# Altium schematic sheet schematic.schdoc
size 431 x 309 mm; Symbol: Sheet-Symbol_A3; Device: Sheet-Symbol_A3; Company: 深圳嘉立创科技发展有限公司; Drawed: 嘉立创EDA; Reviewed: 嘉立创EDA; Version: V0.1; Page Size: A3; @Project Name: 毕设成品 - 一期项目; @Page Count: 3; @Update Date: 2024-11-05; @Create Date: 2024-11-05; @Schematic Name: Schematic1; Part Number: JLCPCB-001; @Page No: 2; @Page Name: 普通版; Convert to PCB: yes; Add into BOM: yes; @Board Name: 1基于STM32单片机智能手环; @Create Time: 14:46:41; @Update Time: 14:47:32; Width: 1656; Height: 1171; Region Start: 1; X Region Count: 1; Y Region Count: 1; Title Block Position: 3
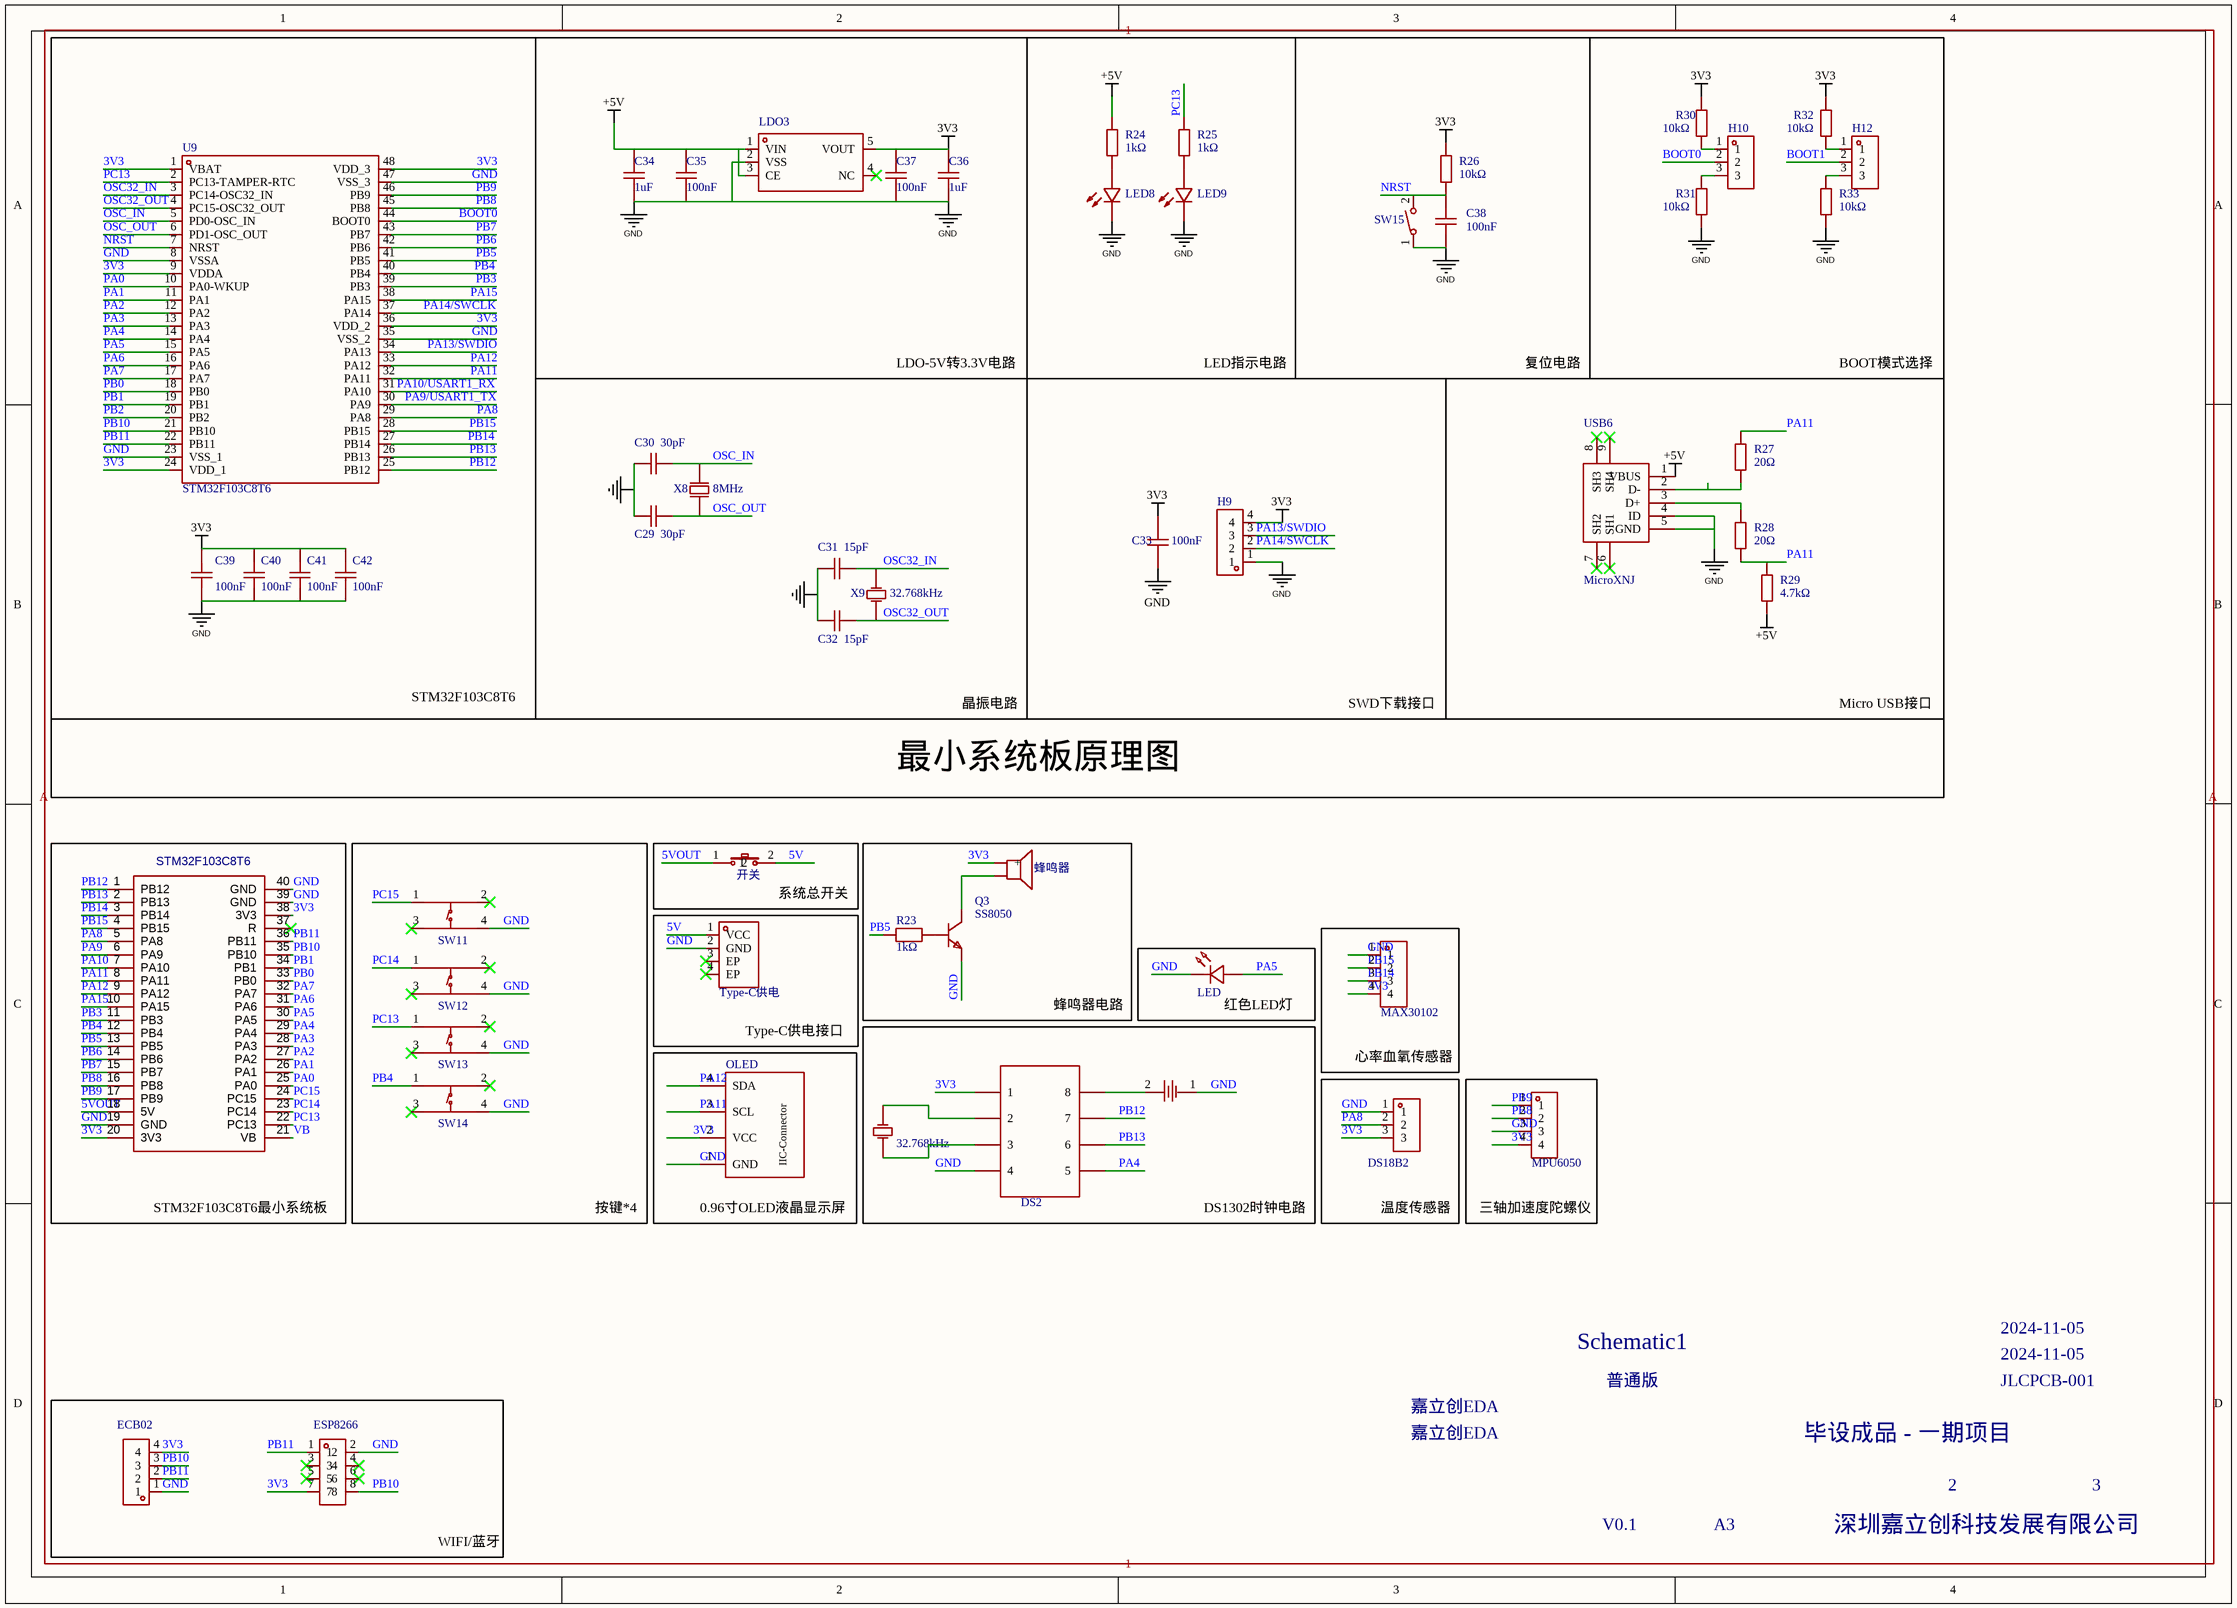
[diagram p0: schematic.schdoc]

## Parts
B3  BS-02-A1AJ010  [BAT-TH_BS-02-A1AJ010]  (value not drawn)
BUZZER  蜂鸣器  [BUZ-TH_BD12.0-P7.60-D0.6-FD]  (value not drawn)
C29  30pF  [C0603]  (value not drawn)
C30  30pF  [C0603]  (value not drawn)
C31  15pF  [C0603]  (value not drawn)
C32  15pF  [C0603]  (value not drawn)
C33  100nF  [C0603]  (value not drawn)
C34  1uF  [C0603]  (value not drawn)
C35  100nF  [C0603]  (value not drawn)
C36  1uF  [C0603]  (value not drawn)
C37  100nF  [C0603]  (value not drawn)
C38  100nF  [C0603]  (value not drawn)
C39  100nF  [C0603]  (value not drawn)
C40  100nF  [C0603]  (value not drawn)
C41  100nF  [C0603]  (value not drawn)
C42  100nF  [C0603]  (value not drawn)
DS2  DS1009-08AT1NX-0A2  [DIP-8_L10.2-W10.2-P2.54-LS7.6-BL]  (value not drawn)
DS18B2  PZ254V-11-03P  [HDR-TH_3P-P2.54-V-M]  (value not drawn)
ECB2  ECB02  [HDR-TH_4P-P2.54-V-F]  (value not drawn)
H9  DZ254W-11-04-65  [HDR-TH_4P-P2.54-H-M-W10.3]  (value not drawn)
H10  PZ254V-11-03P  [HDR-TH_3P-P2.54-V-M]  (value not drawn)
H11  ESP8266  [HDR-TH_8P-P2.54-V-F-R2-C4-S2.54]  (value not drawn)
H12  PZ254V-11-03P  [HDR-TH_3P-P2.54-V-M]  (value not drawn)
LDO3  ME6211C33M5G-N  [SOT-23-5_L3.0-W1.7-P0.95-LS2.8-BL]  (value not drawn)
LED7  LED  [LED-TH_BD3.8-P2.54-FD_GREEN]  (value not drawn)
LED8  NCD0603R1  [LED0603-RD_RED]  (value not drawn)
LED9  NCD0603G1  [LED0603-RD]  (value not drawn)
MAX2  MAX30102  [HDR-TH_4P-P2.54-V-F]  (value not drawn)
MPU2  MPU6050  [HDR-TH_4P-P2.54-V-F]  (value not drawn)
OLED  OLED  [0.96OLED_4P]  (value not drawn)
Q3  SS8050  [TO-92-3_L4.6-W3.6-P1.27-L]  (value not drawn)
R23  1kΩ  [RES-TH_BD2.7-L6.2-P10.20-D0.4]  (value not drawn)
R24  1kΩ  [R0603]  (value not drawn)
R25  1kΩ  [R0603]  (value not drawn)
R26  10kΩ  [R0603]  (value not drawn)
R27  20Ω  [R0603]  (value not drawn)
R28  20Ω  [R0603]  (value not drawn)
R29  4.7kΩ  [R0603]  (value not drawn)
R30  10kΩ  [R0603]  (value not drawn)
R31  10kΩ  [R0603]  (value not drawn)
R32  10kΩ  [R0603]  (value not drawn)
R33  10kΩ  [R0603]  (value not drawn)
SW11  KEY1  [SW-TH_4P-L6.0-W6.0-P4.50-LS6.5]  (value not drawn)
SW12  KEY1  [SW-TH_4P-L6.0-W6.0-P4.50-LS6.5]  (value not drawn)
SW13  KEY1  [SW-TH_4P-L6.0-W6.0-P4.50-LS6.5]  (value not drawn)
SW14  KEY1  [SW-TH_4P-L6.0-W6.0-P4.50-LS6.5]  (value not drawn)
SW15  TS-1101-B-W  [KEY-SMD_2P-L6.0-W3.6-P7.4-LS8.0-L]  (value not drawn)
SWITCH  开关  [KCD11-101]  (value not drawn)
U7  STM32F103C8T6  [STM32F103C8T6]  (value not drawn)
U9  STM32F103C8T6  [LQFP-48_L7.0-W7.0-P0.50-LS9.0-BL]  (value not drawn)
USB5  Type-C供电  [USB-SMD_KH-TYPE-C-2P]  (value not drawn)
USB6  MicroXNJ  [MICRO-USB-SMD_MICROXNJ]  (value not drawn)
X7  32.768kHz  [OSC-TH_BD3.1-P0.8-D0.3]  (value not drawn)
X8  8MHz  [HC-49US_L11.5-W4.5-P4.88]  (value not drawn)
X9  32.768kHz  [OSC-TH_BD2.0-P0.70-D0.3]  (value not drawn)

## Blocks framed on the sheet
最小系统板原理图: C29-C42 H9 H10 H12 LDO3 LED8 LED9 R24-R33 SW15 U9 USB6 X8 X9
STM32F103C8T6最小系统板: U7
按键*4: SW11-SW14
系统总开关: SWITCH
蜂鸣器电路: BUZZER Q3 R23
Type-C供电接口: USB5
心率血氧传感器: MAX2
红色LED灯: LED7
DS1302时钟电路: B3 DS2 X7
0.96寸OLED液晶显示屏: OLED
三轴加速度陀螺仪: MPU2
WIFI/蓝牙: ECB2 H11

## Nets
3V3: BUZZER.1(+) C33.1 C36.2 C37.2 C39.1 C40.1 C41.1 C42.1 DS2.1 DS18B2.3 ECB2.4 H9.4 H11.7 LDO3.5(VOUT) MAX2.4 MPU2.4 OLED.2(VCC) R26.2 R30.2 R32.2 U7.20(3V3) U7.38(3V3) U9.1(VBAT) U9.9(VDDA) U9.24(VDD_1) U9.36(VDD_2) U9.48(VDD_3)
+5V: C34.2 C35.2 LDO3.1(VIN) LDO3.3(CE) R24.1 R29.1 USB6.1(VBUS)
GND: B3.1 C29.2 C30.2 C31.1 C32.1 C33.2 C34.1 C35.1 C36.1 C37.1 C38.1 C39.2 C40.2 C41.2 C42.2 DS2.4 DS18B2.1 ECB2.1 H9.1 H11.2 LDO3.2(VSS) LED7.2(K) LED8.1(K) LED9.1(K) MAX2.1 MPU2.3 OLED.1(GND) Q3.1(E) R31.1 R33.1 SW11.4(D) SW12.4(D) SW13.4(D) SW14.4(D) SW15.1 U7.19(GND) U7.39(GND) U7.40(GND) U9.8(VSSA) U9.23(VSS_1) U9.35(VSS_2) U9.47(VSS_3) USB5.2(GND) USB6.4(ID) USB6.5(GND)
5V: SWITCH.2 USB5.1(VCC)
5VOUT: SWITCH.1 U7.18(5V)
BOOT0: H10.2 U9.44(BOOT0)
BOOT1: H12.2
NRST: C38.2 R26.1 SW15.2 U9.7(NRST)
OSC32_IN: C31.2 U9.3(PC14-OSC32_IN) X9.2(OSC2)
OSC32_OUT: C32.2 U9.4(PC15-OSC32_OUT) X9.1(OSC1)
OSC_IN: C30.1 U9.5(PD0-OSC_IN) X8.2(OSC2)
OSC_OUT: C29.1 U9.6(PD1-OSC_OUT) X8.1(OSC1)
PA0: U7.25(PA0) U9.10(PA0-WKUP)
PA1: U7.26(PA1) U9.11(PA1)
PA2: U7.27(PA2) U9.12(PA2)
PA3: U7.28(PA3) U9.13(PA3)
PA4: DS2.5 U7.29(PA4) U9.14(PA4)
PA5: LED7.1(A) U7.30(PA5) U9.15(PA5)
PA6: U7.31(PA6) U9.16(PA6)
PA7: U7.32(PA7) U9.17(PA7)
PA8: DS18B2.2 U7.5(PA8) U9.29(PA8)
PA9: U7.6(PA9)
PA9/USART1_TX: U9.30(PA9)
PA10: U7.7(PA10)
PA10/USART1_RX: U9.31(PA10)
PA11: OLED.3(SCL) R27.2 R28.1 R29.2 U7.8(PA11) U9.32(PA11)
PA12: OLED.4(SDA) U7.9(PA12) U9.33(PA12)
PA13/SWDIO: H9.3 U9.34(PA13)
PA14/SWCLK: H9.2 U9.37(PA14)
PA15: U7.10(PA15) U9.38(PA15)
PB0: U7.33(PB0) U9.18(PB0)
PB1: U7.34(PB1) U9.19(PB1)
PB2: U9.20(PB2)
PB3: U7.11(PB3) U9.39(PB3)
PB4: SW14.1(A) U7.12(PB4) U9.40(PB4)
PB5: R23.1 U7.13(PB5) U9.41(PB5)
PB6: U7.14(PB6) U9.42(PB6)
PB7: U7.15(PB7) U9.43(PB7)
PB8: MPU2.2 U7.16(PB8) U9.45(PB8)
PB9: MPU2.1 U7.17(PB9) U9.46(PB9)
PB10: ECB2.3 H11.8 U7.35(PB10) U9.21(PB10)
PB11: ECB2.2 H11.1 U7.36(PB11) U9.22(PB11)
PB12: DS2.7 U7.1(PB12) U9.25(PB12)
PB13: DS2.6 U7.2(PB13) U9.26(PB13)
PB14: MAX2.3 U7.3(PB14) U9.27(PB14)
PB15: MAX2.2 U7.4(PB15) U9.28(PB15)
PC13: R25.1 SW13.1(A) U7.22(PC13) U9.2(PC13-TAMPER-RTC)
PC14: SW12.1(A) U7.23(PC14)
PC15: SW11.1(A) U7.24(PC15)
VB: U7.21(VB)
NetB3_2: B3.2 DS2.8
NetBUZZER_2: BUZZER.2 Q3.3(C)
NetDS2_2: DS2.2 X7.2(OSC2)
NetDS2_3: DS2.3 X7.1(OSC1)
NetH10_1: H10.1 R30.1
NetH10_3: H10.3 R31.2
NetH12_1: H12.1 R32.1
NetH12_3: H12.3 R33.2
NetLED8_2: LED8.2(A) R24.2
NetLED9_2: LED9.2(A) R25.2
NetQ3_2: Q3.2(B) R23.2
NetR27_1: R27.1 USB6.2(D-)
NetR28_2: R28.2 USB6.3(D+)

Not connected (* = marked no-connect by the designer): H11 3* 4* 5* 6*; LDO3 4(NC)*; SW11 2(B)* 3(C)*; SW12 2(B)* 3(C)*; SW13 2(B)* 3(C)*; SW14 2(B)* 3(C)*; U7 37(R)*; USB5 3(EP)* 4(EP)*; USB6 6(SH1)* 7(SH2)* 8(SH3)* 9(SH4)*

## Notes on the sheet
- LDO-5V转3.3V电路
- LED指示电路
- 复位电路
- BOOT模式选择
- STM32F103C8T6
- 晶振电路
- SWD下载接口
- Micro USB接口
- 温度传感器
- 1
- A
- Schematic1
- 2024-11-05
- 嘉立创EDA
- 普通版
- 毕设成品 - 一期项目
- JLCPCB-001
- 2
- 3
- V0.1
- A3
- 深圳嘉立创科技发展有限公司
- (in symbol 0.96OLED_4P_MODULE_JX) IIC-Connector

## Library data of the parts
B3 = BS-02-A1AJ010: 连接器类型:电池底座;适用电池规格:CR2032;触头材质:磷青铜;触点电镀:镍;工作温度范围:-25℃~+85℃;; Manufacturer: MYOUNG(美阳); Add into BOM: yes; Connector Type: 电池底座; Battery Type: CR2032; Symbol: BS-02-A1AJ010; Device: BS-02-A1AJ010; LCSC Part Name: 电池底座 适用电池:CR2032; Supplier Part: C5239862; Manufacturer Part: BS-02-A1AJ010; Supplier Footprint: 插件; JLCPCB Part Class: 扩展库; Datasheet: https://atta.szlcsc.com/upload/public/pdf/source/20221102/8F00F2B23A2A3C447A59C327BBA6C743.pdf; Supplier: LCSC; Convert to PCB: yes; Contact Material: 磷青铜; Contact Plating: 镍; Operating Temperature Range: -25℃~+85℃
BUZZER = SUN-12075-5VPA7.6: 驱动方式:有源(内含驱动线路);构造类型:电磁式;额定电压:5V;工作电压:4V~7V;频率:2700Hz;声压(SPL):85dB@5V,10cm;直径(φD):12mm;高度:8mm;; Manufacturer: S&amp;S(海旭); Add into BOM: yes; Technology Type: 电磁式; Rated Voltage: 5V; Operating Voltage: 4V~7V; Symbol: SUN-12075-5VPA7.6; Device: SUN-12075-5VPA7.6; LCSC Part Name: 电磁有源蜂鸣器; Supplier Part: C360613; Manufacturer Part: SUN-12075-5VPA7.6; Supplier Footprint: 插件,P=7.6mm; JLCPCB Part Class: 扩展库; Datasheet: https://atta.szlcsc.com/upload/public/pdf/source/20190311/C360613_1C5D9ABE8587B492981AAE455EC055DD.pdf; Supplier: LCSC; Convert to PCB: yes; Oscillator Circuit: 有源(内含驱动线路); Value: 蜂鸣器; Sound Pressure Level (SPL): 85dB@5V,10cm; Diameter (φD): 12mm; Height: 8mm
C29 C30 = 0603CG300J500NT: 容值:30pF;精度:±5%;额定电压:50V;材质(温度系数):C0G;; Manufacturer: FH(风华); Add into BOM: yes; Tolerance: ±5%; Voltage Rated: 50V; Temperature Coefficient: C0G; Symbol: 0603CG300J500NT; Device: 0603CG300J500NT; LCSC Part Name: 30pF ±5% 50V; Supplier Part: C1658; Manufacturer Part: 0603CG300J500NT; Supplier Footprint: 0603; JLCPCB Part Class: 基础库; Datasheet: https://atta.szlcsc.com/upload/public/pdf/source/20200305/C486355_26A10D38EF8C2A5C37091D0039909270.pdf; Supplier: LCSC; Convert to PCB: yes; Value: 30pF
C31 C32 = CL10C150JB8NNNC: 容值:15pF;精度:±5%;额定电压:50V;材质(温度系数):C0G;; Manufacturer: SAMSUNG(三星); Add into BOM: yes; Tolerance: ±5%; Voltage Rated: 50V; Temperature Coefficient: C0G; Symbol: CL10C150JB8NNNC; Device: CL10C150JB8NNNC; LCSC Part Name: 15pF ±5% 50V; Supplier Part: C1644; Manufacturer Part: CL10C150JB8NNNC; Supplier Footprint: 0603; JLCPCB Part Class: 基础库; Datasheet: https://atta.szlcsc.com/upload/public/pdf/source/20160218/1457707763339.pdf; Supplier: LCSC; Convert to PCB: yes; Value: 15pF
C33 C35 C37-C42 = CC0603KRX7R9BB104: 容值:100nF;精度:±10%;额定电压:50V;材质(温度系数):X7R;; Manufacturer: YAGEO(国巨); Add into BOM: yes; Tolerance: ±10%; Voltage Rated: 50V; Temperature Coefficient: X7R; Symbol: CC0603KRX7R9BB104; Device: CC0603KRX7R9BB104; Supplier: LCSC; Manufacturer Part: CC0603KRX7R9BB104; Value: 100nF; Supplier Part: C14663; JLCPCB Part Class: 基础库; LCSC Part Name: 100nF ±10% 50V; Supplier Footprint: 0603; Datasheet: https://atta.szlcsc.com/upload/public/pdf/source/20180910/C282072_33301C7F631E79921B82A8DAC6BCC5B3.pdf; Convert to PCB: yes
C34 C36 = CL10A105KB8NNNC: 容值:1uF;精度:±10%;额定电压:50V;材质(温度系数):X5R;; Manufacturer: SAMSUNG(三星); Add into BOM: yes; Tolerance: ±10%; Voltage Rated: 50V; Temperature Coefficient: X5R; Symbol: CL10A105KB8NNNC; Device: CL10A105KB8NNNC; LCSC Part Name: 1uF ±10% 50V; Supplier Part: C15849; Manufacturer Part: CL10A105KB8NNNC; Supplier Footprint: 0603; JLCPCB Part Class: 基础库; Datasheet: https://atta.szlcsc.com/upload/public/pdf/source/20160218/1457707763339.pdf; Supplier: LCSC; Convert to PCB: yes; Value: 1uF
DS2 = DS1009-08AT1NX-0A2: 适用IC封装类型:DIP;间距:2.54mm;行距:7.62mm;总针脚数:8P;触头镀层:锡;; Manufacturer: CONNFLY; Add into BOM: yes; IC Type: DIP; Pitch: 2.54mm; Row Spacing: 7.62mm; Number of Positions: 8P; Symbol: DS1009-08AT1NX-0A2; Device: DS1009-08AT1NX-0A2; LCSC Part Name: 间距2.54mm P数:8P; Supplier Part: C72124; Manufacturer Part: DS1009-08AT1NX-0A2; Supplier Footprint: DIP-8; JLCPCB Part Class: 扩展库; Datasheet: https://atta.szlcsc.com/upload/public/pdf/source/20160429/1461922462758.pdf; Supplier: LCSC; Convert to PCB: yes; Contact Plating: 锡
DS18B2 = PZ254V-11-03P: 插针结构:1x3P;间距:2.54mm;行距:-;圆针/方针:方针;安装类型:直插;排数:单排;总PIN位数:3P;额定电流:3A;额定电压:250V;配合针长度:6mm;塑高:2.5mm;端接针长度:3mm;工作温度范围:-40℃~+105℃;颜色:黑色;; Manufacturer: XFCN(兴飞); Symbol: PZ254V-11-03P_C2937625; Add into BOM: yes; Pin Structure: 1x3P; Pitch: 2.54mm; Circluar Pins/Square Pins: 方针; Current Rating (Max): 3A; Voltage Rating (Max): 250V; Color: 黑色; Device: PZ254V-11-03P; LCSC Part Name: 间距:2.54mm 1x3P 直插 方针; Supplier Part: C2937625; Manufacturer Part: PZ254V-11-03P; Supplier Footprint: 插件,P=2.54mm; JLCPCB Part Class: 扩展库; Datasheet: https://atta.szlcsc.com/upload/public/pdf/source/20200309/C492402_8335C3D49C4E4C618838D59BB1D024C1.pdf; Supplier: LCSC; Convert to PCB: yes; Row Spacing: -; Mounting Type: 直插; Number of Rows: 单排; Number of Pins: 3P; Length of Mating Pin: 6mm; Insulation Height: 2.5mm; Length of End Connection Pin: 3mm; Operating Temperature Range: -40℃~+105℃
ECB2 MAX2 MPU2 = HDR-F_2.54_1x4P: Symbol: 2.54-1*4P母; Convert to PCB: yes; Device: HDR-F_2.54_1x4P; Add into BOM: yes; Supplier Part: C2718488; Supplier Footprint: 插件
H9 = DZ254W-11-04-65: 插针结构:1x4P;间距:2.54mm;行距:-;圆针/方针:方针;安装类型:弯插;排数:单排;总PIN位数:4P;额定电流:3A;额定电压:-;配合针长度:6mm;塑高:2.54mm;端接针长度:-;工作温度范围:-;颜色:-;; Manufacturer: DEALON(德艺隆); Add into BOM: yes; Pin Structure: 1x4P; Pitch: 2.54mm; Circluar Pins/Square Pins: 方针; Current Rating (Max): 3A; Symbol: DZ254W-11-04-65; Device: DZ254W-11-04-65; LCSC Part Name: 间距:2.54mm 1x4P 弯插 方针; Supplier Part: C2935929; Manufacturer Part: DZ254W-11-04-65; Supplier Footprint: 弯插,P=2.54mm; JLCPCB Part Class: 扩展库; Datasheet: https://atta.szlcsc.com/upload/public/pdf/source/20211231/CEC96EEC99F3217E207F74B399519373.pdf; Supplier: LCSC; Convert to PCB: yes; Row Spacing: -; Mounting Type: 弯插; Number of Rows: 单排; Number of Pins: 4P; Voltage Rating (Max): -; Length of Mating Pin: 6mm; Insulation Height: 2.54mm; Length of End Connection Pin: -; Operating Temperature Range: -; Color: -
H10 H12 = PZ254V-11-03P: 插针结构:1x3P;间距:2.54mm;行距:-;圆针/方针:方针;安装类型:直插;排数:单排;总PIN位数:3P;额定电流:3A;额定电压:250V;配合针长度:6mm;塑高:2.5mm;端接针长度:3mm;工作温度范围:-40℃~+105℃;颜色:黑色;; Manufacturer: XFCN(兴飞); Symbol: PZ254V-11-03P_C2937625; Add into BOM: yes; Pin Structure: 1x3P; Pitch: 2.54mm; Circluar Pins/Square Pins: 方针; Current Rating (Max): 3A; Voltage Rating (Max): 250V; Device: PZ254V-11-03P; LCSC Part Name: 间距:2.54mm 1x3P 直插 方针; Supplier Part: C2937625; Manufacturer Part: PZ254V-11-03P; Supplier Footprint: 插件,P=2.54mm; JLCPCB Part Class: 扩展库; Datasheet: https://atta.szlcsc.com/upload/public/pdf/source/20200309/C492402_8335C3D49C4E4C618838D59BB1D024C1.pdf; Supplier: LCSC; Convert to PCB: yes; Row Spacing: -; Mounting Type: 直插; Number of Rows: 单排; Number of Pins: 3P; Length of Mating Pin: 6mm; Insulation Height: 2.5mm; Length of End Connection Pin: 3mm; Operating Temperature Range: -40℃~+105℃; Color: 黑色
H11 = PM254V-12-08-H85: 插孔结构:2x4P;间距:2.54mm;行距:2.54mm;圆孔/方孔:方孔;安装类型:直插;排数:双排;总孔位数:8P;额定电流:3A;额定电压:250V;插孔方向:顶部;塑高:8.5mm;工作温度范围:-40℃~+105℃;; Manufacturer: XFCN(兴飞); Symbol: PM254V-12-08-H85_C2834799; Add into BOM: yes; Holes Structure: 2x4P; Pitch: 2.54mm; Circular Hole / Square Hole: 方孔; Number of Holes: 8P; Current Rating (Max): 3A; Voltage Rating (Max): 250V; Holes Direction: 顶部; Device: PM254V-12-08-H85; Supplier: LCSC; Supplier Part: C2834799; Manufacturer Part: PM254V-12-08-H85; JLCPCB Part Class: 扩展库; LCSC Part Name: 间距:2.54mm 2x4P 直插; Supplier Footprint: 插件,P=2.54mm; Datasheet: https://atta.szlcsc.com/upload/public/pdf/source/20200309/C492399_8C441E2934FBB604A89B37A68AA45ECF.pdf; Convert to PCB: yes; Row Spacing: 2.54mm; Mounting Type: 直插; Number of Rows: 双排; Insulation Height: 8.5mm; Operating Temperature Range: -40℃~+105℃
LDO3 = ME6211C33M5G-N: 输出类型:固定;最大输入电压:6V;输出电压:3.3V;最大输出电流:500mA;电源纹波抑制比(PSRR):70dB;输出极性:正极;; Manufacturer: MICRONE(南京微盟); Add into BOM: yes; Output Type: 固定; Maximum Input Voltage: 6V; Output Voltage: 3.3V; MAX Output Current: 500mA; Power Supply Rejection Ratio (PSRR): 70dB; Dropout Voltage: 260mV@(200mA); Output Polarity: 正极; Number of Outputs: 1; Symbol: ME6211C33M5G-N; Device: ME6211C33M5G-N; LCSC Part Name: 输入6V 输出3.3V 500mA; Supplier Part: C82942; Manufacturer Part: ME6211C33M5G-N; Supplier Footprint: SOT-23-5; JLCPCB Part Class: 扩展库; Datasheet: https://atta.szlcsc.com/upload/public/pdf/source/20170918/C82942_1505727073070976520.pdf; Supplier: LCSC; Convert to PCB: yes
LED7 = XL-302UGD: 灯头类型:3mm圆形灯头;发光颜色:翠绿色;功率:80mW;正向电流:30mA;主波长:510nm~520nm;透镜颜色:绿色透镜;色温:-;发光角度:50°;载带方式:-;工作温度:-25℃~+85℃;; Manufacturer: XINGLIGHT(成兴光); Add into BOM: yes; Emitted Color: 翠绿色; Power Dissipation: 80mW; Forward Current: 30mA; Peak Wavelength: 525nm; Lens Color: 绿色透镜; Viewing Angle: 50°; Symbol: XL-302UGD; Device: XL-302UGD; LCSC Part Name: XL-302UGD; Supplier Part: C2895476; Manufacturer Part: XL-302UGD; Supplier Footprint: 插件,D=3mm; JLCPCB Part Class: 扩展库; Datasheet: https://atta.szlcsc.com/upload/public/pdf/source/20240112/A4C1FE2F91E20BD07CDB872CEF78D7A0.pdf; Supplier: LCSC; Convert to PCB: yes; Lamp Holder Type: 3mm圆形灯头; Dominant Wavelength: 510nm~520nm; Color Temperature: -; Mounting Sytle: -; Operating Temperature: -25℃~+85℃
LED8 = NCD0603R1_C84263: 灯头类型:-;发光颜色:红色;正向电压(VF):1.6V~2.6V;功率:65mW;正向电流:20mA;主波长:615nm~630nm;二极管配置:独立二极管;透镜颜色:无色透明透镜;色温:-;发光强度:80mcd~220mcd;发光角度:130°;载带方式:-;工作温度:-30℃~+85℃;; Manufacturer: 国星光电; Symbol: FC-DA1608HRK-620D; Add into BOM: yes; Emitted Color: 红色; Power Dissipation: 65mW; Forward Current: 20mA; Diode Configuration: 独立二极管; Lens Color: 无色透明透镜; Viewing Angle: 130°; Device: NCD0603R1_C84263; Supplier: LCSC; Manufacturer Part: NCD0603R1; Supplier Part: C84263; JLCPCB Part Class: 扩展库; LCSC Part Name: NCD0603R1; Supplier Footprint: 0603; Datasheet: https://atta.szlcsc.com/upload/public/pdf/source/20200820/C84263_DABC6A75E58F576973B407FDBA283D60.pdf; Convert to PCB: yes; Lamp Holder Type: -; Forward Voltage (VF): 1.6V~2.6V; Dominant Wavelength: 615nm~630nm; Peak Wavelength: -; Color Temperature: -; Luminous Intensity: 80mcd~220mcd; Mounting Sytle: -; Operating Temperature: -30℃~+85℃
LED9 = NCD0603G1: 发光颜色:翠绿色;正向电压(VF):2.6V~3.6V;功率:72mW;正向电流:10mA;主波长:515nm~530nm;透镜颜色:无色透明透镜;发光强度:330mcd~900mcd;发光角度:130°;工作温度:-30℃~+85℃;; Manufacturer: 国星光电; Symbol: FC-D1608UGK-520D10; Add into BOM: yes; Emitted Color: 翠绿色; Power Dissipation: 72mW; Forward Current: 10mA; Lens Color: 无色透明透镜; Viewing Angle: 130°; Device: NCD0603G1; LCSC Part Name: NCD0603G1; Supplier Part: C84267; Manufacturer Part: NCD0603G1; Supplier Footprint: 0603; JLCPCB Part Class: 扩展库; Datasheet: https://atta.szlcsc.com/upload/public/pdf/source/20200820/C84267_04BA7703640BAC111D09F5EFB971FBF3.pdf; Supplier: LCSC; Convert to PCB: yes; Forward Voltage (VF): 2.6V~3.6V; Dominant Wavelength: 515nm~530nm; Luminous Intensity: 330mcd~900mcd; Operating Temperature: -30℃~+85℃
OLED = 0.96OLED_4P_MODULE_JX: Add into BOM: yes; Symbol: 0.96oled_4p_module_jx; Device: 0.96OLED_4P_MODULE_JX; LCSC Part Name: 0.96OLED_4P_MODULE_JX; Supplier Part: C9900004566; Manufacturer Part: 0.96OLED_4P_MODULE_JX; Supplier Footprint: 插件; JLCPCB Part Class: 扩展库; Datasheet: https://atta.szlcsc.comnull; Supplier: LCSC; Convert to PCB: yes
Q3 = SS8050_C2931495: 晶体管类型:NPN;集电极电流(Ic):1.5A;集射极击穿电压(Vceo):25V;功率(Pd):1W;直流电流增益(hFE@Ic,Vce):200@100mA,1V;; Manufacturer: JSMSEMI(杰盛微); Add into BOM: yes; Transistor Type: NPN; Collector Current (Ic): 1.5A; Collector-Emitter Breakdown Voltage (Vceo): 25V; Power Dissipation (Pd): 1W; Transition Frequency (fT): 100MHz; Collector Cut-Off Current (Icbo): 100nA; Collector-Emitter Saturation Voltage (VCE(sat)@Ic,Ib): 500mV@800mA,80mA; Symbol: SS8050_C2931495; Device: SS8050_C2931495; LCSC Part Name: NPN 电流:1.5A 耐压:25V; Supplier Part: C2931495; Manufacturer Part: SS8050; Supplier Footprint: TO-92-3; JLCPCB Part Class: 扩展库; Datasheet: https://atta.szlcsc.com/upload/public/pdf/source/20240105/C1870B353FEE38831A28EA54E28A0B92.pdf; Supplier: LCSC; Convert to PCB: yes; DC Current Gain (hFE@Ic,Vce): 200@100mA,1V; Operating Temperature: -55℃~+150℃@(Tj)
R23 = MF1/4W-1K±1%-ST52: 电阻类型:金属膜电阻;阻值:1kΩ;精度:±1%;功率:250mW;温度系数:±100ppm/℃;; Manufacturer: VO(翔胜); Add into BOM: yes; Tolerance: ±1%; Overload Voltage (Max): 250V; Power(Watts): 250mW; Symbol: MF1/4W-1K±1%-ST52; Device: MF1/4W-1K±1%-ST52; LCSC Part Name: 金属膜电阻 1kΩ ±1% 250mW; Supplier Part: C2903245; Manufacturer Part: MF1/4W-1K±1%-ST52; Supplier Footprint: 插件,D2.7xL6.2mm; JLCPCB Part Class: 扩展库; Datasheet: https://atta.szlcsc.com/upload/public/pdf/source/20200609/C601728_5AA4C0C8E12E11069DA2C3356F29D1F2.pdf; Supplier: LCSC; Convert to PCB: yes; Type: 金属膜电阻; Value: 1kΩ; Temperature Coefficient: ±100ppm/℃; Operating Temperature Range: -55℃~+155℃
R24 R25 = 0603WAF1001T5E: 电阻类型:厚膜电阻;阻值:1kΩ;精度:±1%;功率:100mW;最大工作电压:75V;温度系数:±100ppm/℃;; Manufacturer: UNI-ROYAL(厚声); Add into BOM: yes; Tolerance: ±1%; Power(Watts): 100mW; Overload Voltage (Max): 75V; Symbol: 0603WAF1001T5E; Device: 0603WAF1001T5E; Supplier: LCSC; Manufacturer Part: 0603WAF1001T5E; Supplier Part: C21190; Value: 1kΩ; JLCPCB Part Class: 基础库; LCSC Part Name: 1kΩ ±1% 100mW 厚膜电阻; Supplier Footprint: 0603; Datasheet: https://atta.szlcsc.com/upload/public/pdf/source/20200306/C422600_1E6D84923E4A46A82E41ADD87F860B5C.pdf; Convert to PCB: yes; Type: 厚膜电阻; Temperature Coefficient: ±100ppm/℃; Operating Temperature Range: -55℃~+155℃
R26 R30-R33 = 0603WAF1002T5E: 电阻类型:厚膜电阻;阻值:10kΩ;精度:±1%;功率:100mW;最大工作电压:75V;温度系数:±100ppm/℃;; Manufacturer: UNI-ROYAL(厚声); Add into BOM: yes; Tolerance: ±1%; Power(Watts): 100mW; Overload Voltage (Max): 75V; Symbol: 0603WAF1002T5E; Device: 0603WAF1002T5E; Supplier: LCSC; Manufacturer Part: 0603WAF1002T5E; Supplier Part: C25804; Value: 10kΩ; JLCPCB Part Class: 基础库; LCSC Part Name: 厚膜电阻 10kΩ ±1% 100mW; Supplier Footprint: 0603; Datasheet: https://atta.szlcsc.com/upload/public/pdf/source/20200306/C422600_1E6D84923E4A46A82E41ADD87F860B5C.pdf; Convert to PCB: yes; Type: 厚膜电阻; Temperature Coefficient: ±100ppm/℃; Operating Temperature Range: -55℃~+155℃
R27 R28 = 0603WAF200JT5E: 电阻类型:厚膜电阻;阻值:20Ω;精度:±1%;功率:100mW;最大工作电压:75V;温度系数:±100ppm/℃;; Manufacturer: UNI-ROYAL(厚声); Add into BOM: yes; Tolerance: ±1%; Power(Watts): 100mW; Overload Voltage (Max): 75V; Symbol: 0603WAF200JT5E; Device: 0603WAF200JT5E; Supplier: LCSC; Manufacturer Part: 0603WAF200JT5E; Supplier Part: C22950; Value: 20Ω; JLCPCB Part Class: 基础库; LCSC Part Name: 20Ω ±1% 100mW 厚膜电阻; Supplier Footprint: 0603; Datasheet: https://atta.szlcsc.com/upload/public/pdf/source/20200306/C422600_1E6D84923E4A46A82E41ADD87F860B5C.pdf; Convert to PCB: yes; Type: 厚膜电阻; Temperature Coefficient: ±100ppm/℃; Operating Temperature Range: -55℃~+155℃
R29 = 0603WAF4701T5E: 电阻类型:厚膜电阻;阻值:4.7kΩ;精度:±1%;功率:100mW;最大工作电压:75V;温度系数:±100ppm/℃;; Manufacturer: UNI-ROYAL(厚声); Add into BOM: yes; Tolerance: ±1%; Power(Watts): 100mW; Overload Voltage (Max): 75V; Symbol: 0603WAF4701T5E; Device: 0603WAF4701T5E; LCSC Part Name: 4.7kΩ ±1% 100mW 厚膜电阻; Supplier Part: C23162; Manufacturer Part: 0603WAF4701T5E; Supplier Footprint: 0603; JLCPCB Part Class: 基础库; Datasheet: https://atta.szlcsc.com/upload/public/pdf/source/20200306/C422600_1E6D84923E4A46A82E41ADD87F860B5C.pdf; Supplier: LCSC; Convert to PCB: yes; Type: 厚膜电阻; Value: 4.7kΩ; Temperature Coefficient: ±100ppm/℃; Operating Temperature Range: -55℃~+155℃
SW11-SW14 = TS665CJ: 电路结构:单刀单掷;按钮形状:圆形按钮;安装方式:直插;开关长度:6mm;开关宽度:6mm;开关高度:5mm;触点电流:50mA;额定电压(DC):12V;带灯:-;机械寿命:-;; Manufacturer: SHOU HAN(首韩); Add into BOM: yes; Circuit: 单刀单掷; Actuator Style: 圆形按钮; Switch Length: 6mm; Switch Height: 5mm; Contact Current: 50mA; Voltage Rating (DC): 12V; Symbol: TS665CJ; Device: TS665CJ; Supplier: LCSC; Supplier Part: C393938; Manufacturer Part: KEY1; JLCPCB Part Class: 扩展库; LCSC Part Name: 6*6*5mm 直插 轻触开关; Supplier Footprint: 插件; Datasheet: https://atta.szlcsc.com/upload/public/pdf/source/20190521/C393938_BDABEAC600B4C55E200A80AA129B70BC.pdf; Convert to PCB: yes; Mounting Style: 直插; Switch Width: 6mm; With Lamp: -; Mechanical Life: -
SW15 = TS-1101-B-W_C500065: 电路结构:单刀单掷;按钮形状:矩形按钮;作用力:160gf;安装方式:立贴;开关长度:6mm;开关宽度:3.6mm;开关高度:2.5mm;带支架:不带;触点电流:50mA;额定电压(DC):12V;绝缘电阻:-;带灯:无;机械寿命:5万次;; Manufacturer: XKB Connectivity(中国星坤); Add into BOM: yes; Circuit: 单刀单掷; Actuator Style: 矩形按钮; Operating Force: 160gf; Switch Length: 6mm; Switch Width: 3.6mm; Switch Height: 2.5mm; Strike Gundam: 不带; Contact Current: 50mA; Voltage Rating (DC): 12V; Actuator/Cap Color: 白色; With Lamp: 无; Mechanical Life: 5万次; Symbol: TS-1101-B-W; Device: TS-1101-B-W_C500065; LCSC Part Name: 6*3.6*2.5mm 立贴 轻触开关; Supplier Part: C500065; Manufacturer Part: TS-1101-B-W; Supplier Footprint: SMD; JLCPCB Part Class: 扩展库; Datasheet: https://atta.szlcsc.com/upload/public/pdf/source/20211011/D0E0CAF534F7B19DDE4CE68748A25BD3.pdf; Supplier: LCSC; Convert to PCB: yes; Mounting Style: 立贴; Insulation Resistance: -; Operating Temperature: -30℃~+85℃
SWITCH = KCD11-101_开关: Pin Type: IN; Add into BOM: yes; Symbol: KCD11-101_开关; Device: KCD11-101_开关; Convert to PCB: yes; Origin Footprint: KCD11-101
U7 = STM32F103C8T6: Convert to PCB: yes; Symbol: STM32F103C8T6; Device: STM32F103C8T6; Add into BOM: yes; Origin Footprint: STM32F103C8T6
U9 = STM32F103C8T6: CPU内核:ARM-M3;程序存储容量:64KB;RAM总容量:20KB;GPIO端口数量:37;工作电压范围:2V~3.6V;CPU最大主频:72MHz;程序存储器类型:FLASH;; Manufacturer: ST(意法半导体); Add into BOM: yes; CPU Core: ARM-M3; Program Storage Size: 64KB; RAM Size: 20KB; GPIO Ports Number: 37; CPU Maximum Speed: 72MHz; Program Memory Type: FLASH; ADC (Bit): 12bit; Universal Serial Bus: 有; Peripheral/Function: 看门狗；DMA；看门狗；温度传感器; Symbol: STM32F103C8T6; Device: STM32F103C8T6; LCSC Part Name: 主流增强型ARM Cortex-M3 MCU，具有64 KB Flash、72 MHz CPU、电机控制、USB和CAN; Supplier Part: C8734; Manufacturer Part: STM32F103C8T6; Supplier Footprint: LQFP-48(7x7); JLCPCB Part Class: 扩展库; Datasheet: https://atta.szlcsc.com/upload/public/pdf/source/20220812/8363ACEC51AD55ECEB84799464F7CB85.pdf; Supplier: LCSC; Convert to PCB: yes; Operating Voltage Range: 2V~3.6V; Operating Temperature Range: -40℃~+85℃; DAC (Bit): -; PWM (Bit): -; Internal Comparator: -; communication protocol: -; Watchdog: 有; Real-Time Clock: -; Infrared Data Association: 有; Low-Voltage Detect: 有; CCP Capture/Compare: -; Secure Digital Input and Output: -; Direct Memory Access: 有; Internal Oscillator: 有
USB5 = KH-TYPE-C-2P: 连接器类型:Type-C;标准:-;公母:-;端口数量:-;触点数量:2P;安装方式:-;额定电流 - 电源:-;触头材质:-;触头镀层:-;工作温度范围:-;; Manufacturer: kinghelm(金航标); Add into BOM: yes; Connector Type: Type-C; Number of Contacts: 2P; Symbol: KH-TYPE-C-2P; Device: KH-TYPE-C-2P; LCSC Part Name: Type-C; Supplier Part: C2919656; Manufacturer Part: KH-TYPE-C-2P; Supplier Footprint: 插件; JLCPCB Part Class: 扩展库; Datasheet: https://atta.szlcsc.com/upload/public/pdf/source/20220707/620587A9E0589B27D96D3CEE595CBC98.pdf; Supplier: LCSC; Convert to PCB: yes; Standard: -; Gender: -; Number of Ports: -; Mounting Style: -; Current Rating - Power (Max): -; Contact Material: -; Contact Plating: -; Operating Temperature Range: -
USB6 = MicroXNJ: 连接器类型:Micro-B;标准:USB 2.0;公母:母;安装方式:卧贴;触点数量:5P;端口数量:1;额定电流 - 电源:1.8A;工作温度范围:-20℃~+85℃;; Manufacturer: SHOU HAN(首韩); Add into BOM: yes; Gender: 母; Number of Contacts: 5P; Number of Ports: 1; Current Rating - Power (Max): 1.8A; Rated Voltage (Max): 30V; Connect-Disconnect Life: 5千次; Core Colour: 黑色; Symbol: MICROXNJ; Device: MicroXNJ; LCSC Part Name: Micro-B 母 卧贴; Supplier Part: C404969; Manufacturer Part: MicroXNJ; Supplier Footprint: SMD; JLCPCB Part Class: 扩展库; Datasheet: https://atta.szlcsc.com/upload/public/pdf/source/20220415/2494EDFF499AF6F852F7C820374B6AF3.pdf; Supplier: LCSC; Convert to PCB: yes; Connector Type: Micro-B; Standard: USB 2.0; Mounting Style: 卧贴; Operating Temperature Range: -20℃~+85℃
X7 = X308032768KGB2SC: 晶振类型:直插晶振;频率:32.768kHz;常温频差:±10ppm;外接负载电容:12.5pF;频率稳定度(全温):-;; Manufacturer: YXC(扬兴晶振); Add into BOM: yes; Crystal Type: 直插晶振; Normal temperature Frequency Tolerance: ±10ppm; External load capacitor: 12.5pF; Symbol: X308032768KGB2SC; Device: X308032768KGB2SC; LCSC Part Name: 32.768kHz ±10ppm 12.5pF YT-38; Supplier Part: C52082; Manufacturer Part: X308032768KGB2SC; Supplier Footprint: DT-38; JLCPCB Part Class: 扩展库; Datasheet: https://atta.szlcsc.com/upload/public/pdf/source/20240329/231E1A1EB7C875CD193DBE6664A3DE3A.pdf; Supplier: LCSC; Convert to PCB: yes; Value: 32.768kHz; Frequency Stability(Full temperature range): -; Operating Temperature: -20℃~+70℃
X8 = X49SD8MSB2SI: 晶振类型:直插晶振;频率:8MHz;常温频差:±10ppm;外接负载电容:20pF;频率稳定度(全温):±30ppm;; Manufacturer: YXC(扬兴晶振); Add into BOM: yes; Crystal Type: 直插晶振; Normal temperature Frequency Tolerance: ±10ppm; External load capacitor: 20pF; Frequency Stability(Full temperature range): ±30ppm; Symbol: X49SD8MSB2SI; Device: X49SD8MSB2SI; LCSC Part Name: 8MHz ±10ppm 20pF; Supplier Part: C188205; Manufacturer Part: X49SD8MSB2SI; Supplier Footprint: HC-49S; JLCPCB Part Class: 扩展库; Datasheet: https://atta.szlcsc.com/upload/public/pdf/source/20240329/977D7F2434F98B2BE33270BB9FF3D86D.pdf; Supplier: LCSC; Convert to PCB: yes; Value: 8MHz; Operating Temperature: -40℃~+85℃
X9 = X206032768KGB2SC: 晶振类型:直插晶振;频率:32.768kHz;常温频差:±10ppm;外接负载电容:12.5pF;频率稳定度(全温):-;; Manufacturer: YXC(扬兴晶振); Add into BOM: yes; Crystal Type: 直插晶振; Normal temperature Frequency Tolerance: ±10ppm; External load capacitor: 12.5pF; Symbol: X206032768KGB2SC; Device: X206032768KGB2SC; LCSC Part Name: 32.768kHz ±10ppm 12.5pF YT-26; Supplier Part: C2236; Manufacturer Part: X206032768KGB2SC; Supplier Footprint: DT-26; JLCPCB Part Class: 扩展库; Datasheet: https://atta.szlcsc.com/upload/public/pdf/source/20240329/2B52AA05409D3B1EC46EE0917D3AF97A.pdf; Supplier: LCSC; Convert to PCB: yes; Value: 32.768kHz; Frequency Stability(Full temperature range): -; Operating Temperature: -20℃~+70℃